# Altium schematic sheet stm32h750.SchDoc
size A3; SheetNumber: 5; SheetTotal: 17
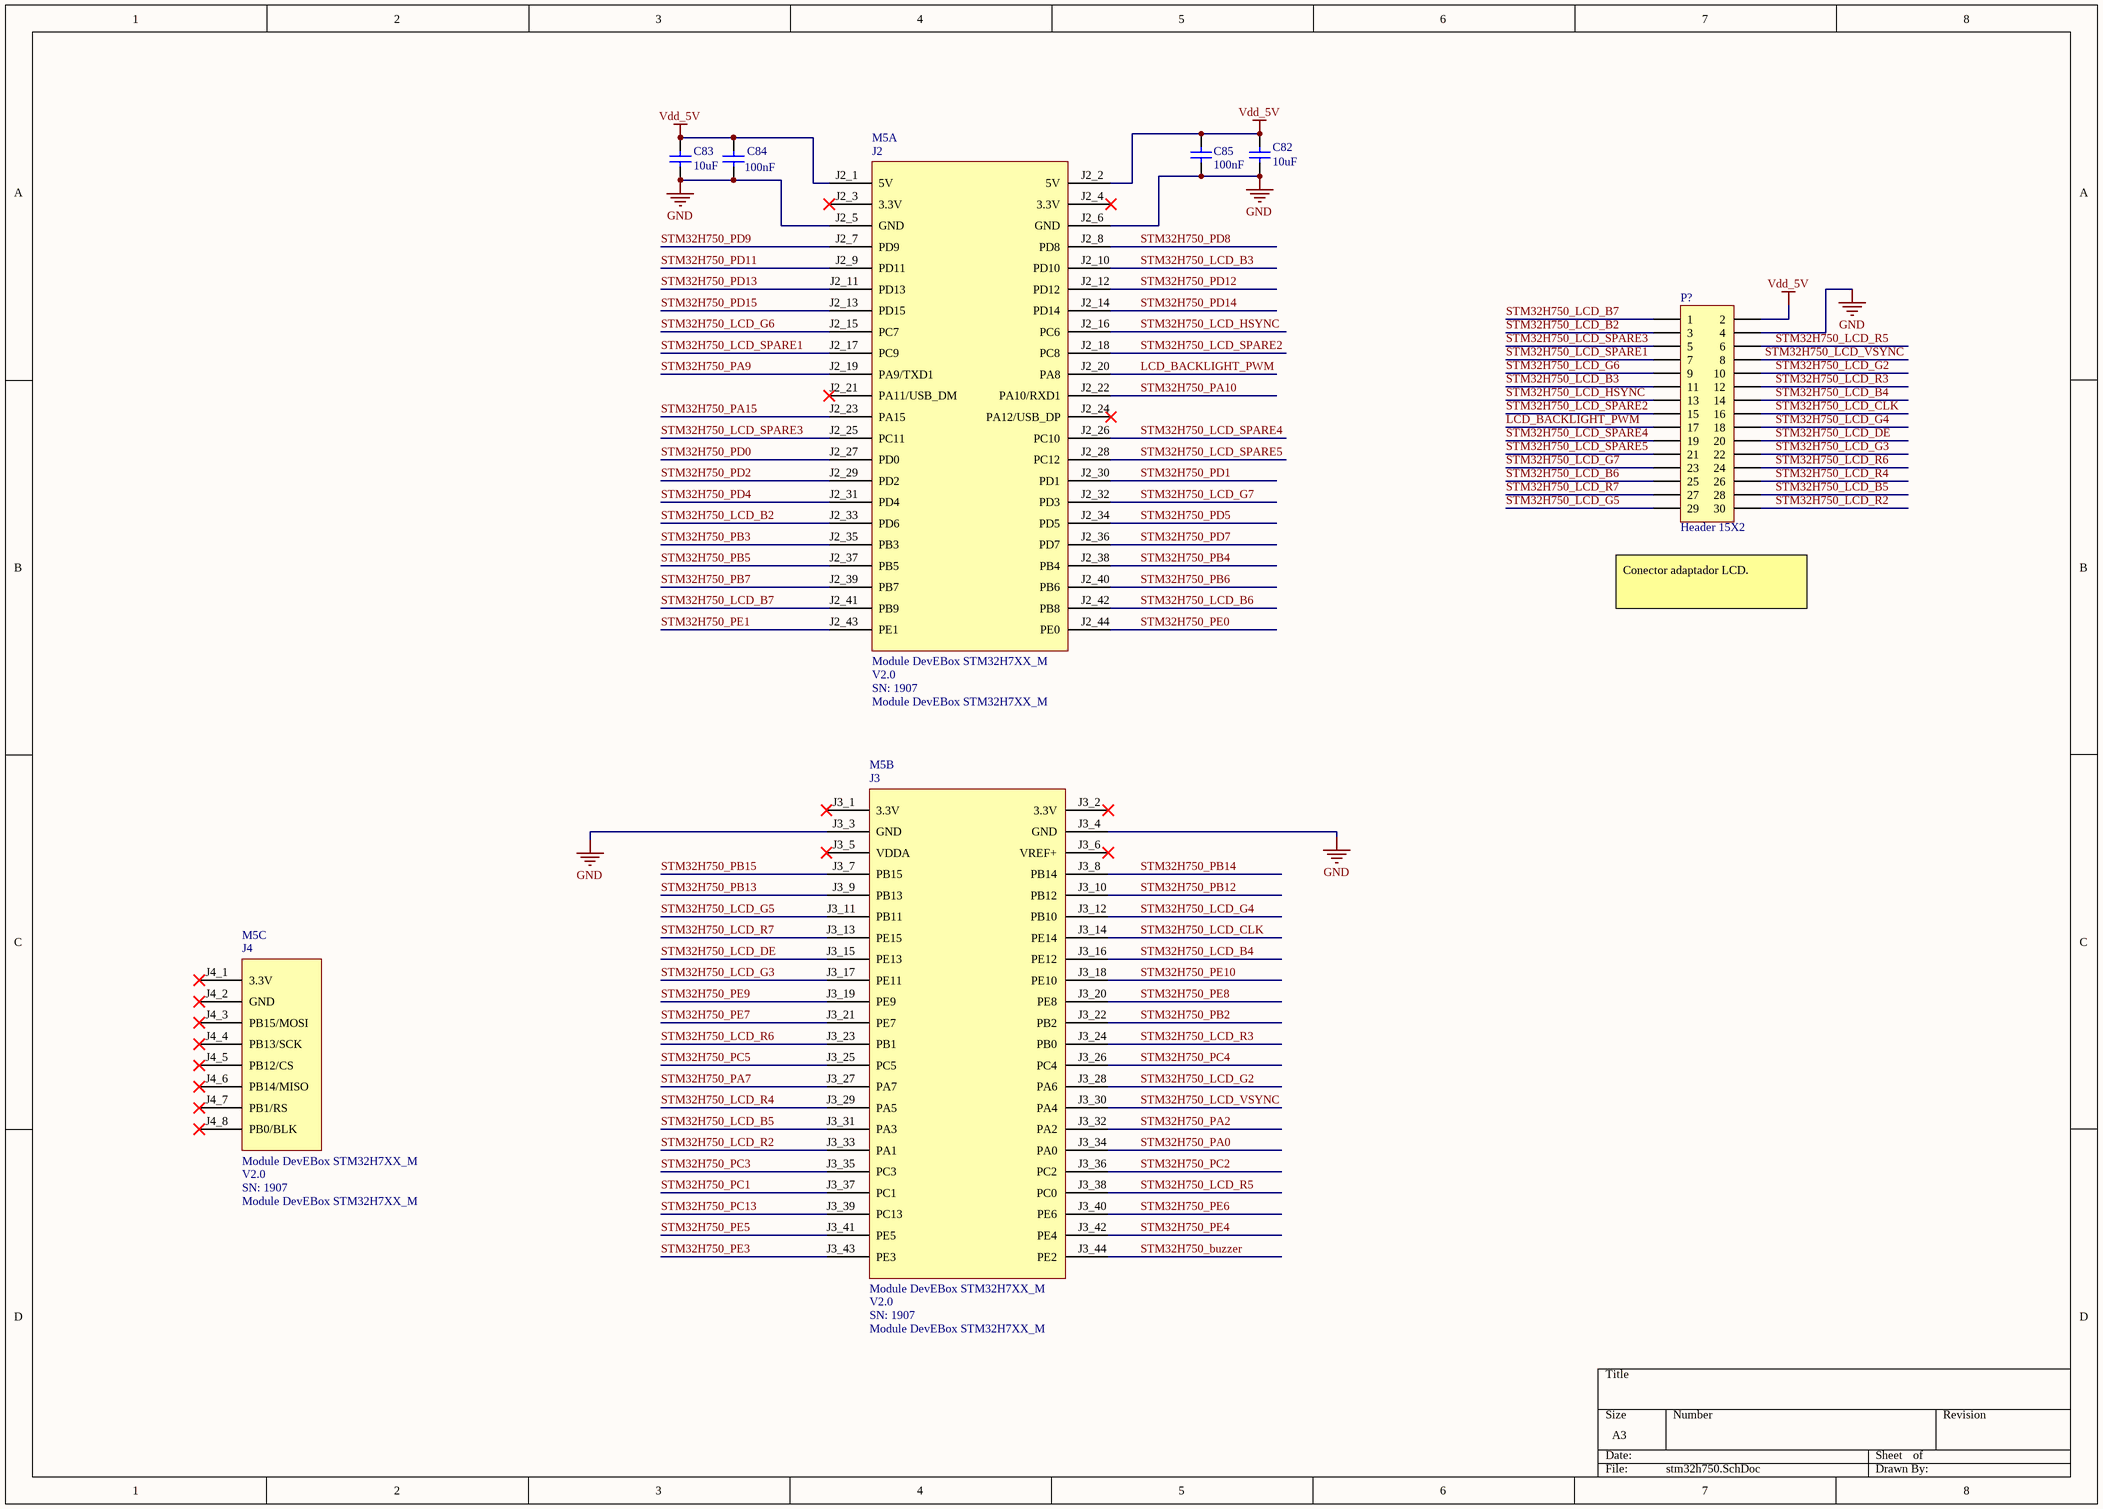
[diagram p0: stm32h750.SchDoc]

## Parts
C82  value 10uF  [capacitor 0603]  (hidden comment: ceramic capacitor)
C83  value 10uF  [capacitor 0603]  (hidden comment: ceramic capacitor)
C84  value 100nF  [capacitor 0603]  (hidden comment: Ceramic capacitor)
C85  value 100nF  [capacitor 0603]  (hidden comment: Ceramic capacitor)
M5  Module DevEBox STM32H7XX_M  [Module DevEBox STM32H7XX_M]  (parts A,B,C of 3)
P?  Header 15X2  [HDR2X15]

## Nets
GND: C82.1 C83.1 C84.1 C85.1 M5.J2_5(GND) M5.J2_6(GND) M5.J3_3(GND) M5.J3_4(GND) P?.4
Vdd_5V: C82.2 C83.2 C84.2 C85.2 M5.J2_1(5V) M5.J2_2(5V) P?.2
LCD_BACKLIGHT_PWM: M5.J2_20(PA8) P?.17
STM32H750_buzzer: M5.J3_44(PE2)
STM32H750_LCD_B2: M5.J2_33(PD6) P?.3
STM32H750_LCD_B3: M5.J2_10(PD10) P?.11
STM32H750_LCD_B4: M5.J3_16(PE12) P?.14
STM32H750_LCD_B5: M5.J3_31(PA3) P?.28
STM32H750_LCD_B6: M5.J2_42(PB8) P?.25
STM32H750_LCD_B7: M5.J2_41(PB9) P?.1
STM32H750_LCD_CLK: M5.J3_14(PE14) P?.16
STM32H750_LCD_DE: M5.J3_15(PE13) P?.20
STM32H750_LCD_G2: M5.J3_28(PA6) P?.10
STM32H750_LCD_G3: M5.J3_17(PE11) P?.22
STM32H750_LCD_G4: M5.J3_12(PB10) P?.18
STM32H750_LCD_G5: M5.J3_11(PB11) P?.29
STM32H750_LCD_G6: M5.J2_15(PC7) P?.9
STM32H750_LCD_G7: M5.J2_32(PD3) P?.23
STM32H750_LCD_HSYNC: M5.J2_16(PC6) P?.13
STM32H750_LCD_R2: M5.J3_33(PA1) P?.30
STM32H750_LCD_R3: M5.J3_24(PB0) P?.12
STM32H750_LCD_R4: M5.J3_29(PA5) P?.26
STM32H750_LCD_R5: M5.J3_38(PC0) P?.6
STM32H750_LCD_R6: M5.J3_23(PB1) P?.24
STM32H750_LCD_R7: M5.J3_13(PE15) P?.27
STM32H750_LCD_SPARE1: M5.J2_17(PC9) P?.7
STM32H750_LCD_SPARE2: M5.J2_18(PC8) P?.15
STM32H750_LCD_SPARE3: M5.J2_25(PC11) P?.5
STM32H750_LCD_SPARE4: M5.J2_26(PC10) P?.19
STM32H750_LCD_SPARE5: M5.J2_28(PC12) P?.21
STM32H750_LCD_VSYNC: M5.J3_30(PA4) P?.8
STM32H750_PA0: M5.J3_34(PA0)
STM32H750_PA2: M5.J3_32(PA2)
STM32H750_PA7: M5.J3_27(PA7)
STM32H750_PA9: M5.J2_19(PA9/TXD1)
STM32H750_PA10: M5.J2_22(PA10/RXD1)
STM32H750_PA15: M5.J2_23(PA15)
STM32H750_PB2: M5.J3_22(PB2)
STM32H750_PB3: M5.J2_35(PB3)
STM32H750_PB4: M5.J2_38(PB4)
STM32H750_PB5: M5.J2_37(PB5)
STM32H750_PB6: M5.J2_40(PB6)
STM32H750_PB7: M5.J2_39(PB7)
STM32H750_PB12: M5.J3_10(PB12)
STM32H750_PB13: M5.J3_9(PB13)
STM32H750_PB14: M5.J3_8(PB14)
STM32H750_PB15: M5.J3_7(PB15)
STM32H750_PC1: M5.J3_37(PC1)
STM32H750_PC2: M5.J3_36(PC2)
STM32H750_PC3: M5.J3_35(PC3)
STM32H750_PC4: M5.J3_26(PC4)
STM32H750_PC5: M5.J3_25(PC5)
STM32H750_PC13: M5.J3_39(PC13)
STM32H750_PD0: M5.J2_27(PD0)
STM32H750_PD1: M5.J2_30(PD1)
STM32H750_PD2: M5.J2_29(PD2)
STM32H750_PD4: M5.J2_31(PD4)
STM32H750_PD5: M5.J2_34(PD5)
STM32H750_PD7: M5.J2_36(PD7)
STM32H750_PD8: M5.J2_8(PD8)
STM32H750_PD9: M5.J2_7(PD9)
STM32H750_PD11: M5.J2_9(PD11)
STM32H750_PD12: M5.J2_12(PD12)
STM32H750_PD13: M5.J2_11(PD13)
STM32H750_PD14: M5.J2_14(PD14)
STM32H750_PD15: M5.J2_13(PD15)
STM32H750_PE0: M5.J2_44(PE0)
STM32H750_PE1: M5.J2_43(PE1)
STM32H750_PE3: M5.J3_43(PE3)
STM32H750_PE4: M5.J3_42(PE4)
STM32H750_PE5: M5.J3_41(PE5)
STM32H750_PE6: M5.J3_40(PE6)
STM32H750_PE7: M5.J3_21(PE7)
STM32H750_PE8: M5.J3_20(PE8)
STM32H750_PE9: M5.J3_19(PE9)
STM32H750_PE10: M5.J3_18(PE10)

Not connected (* = marked no-connect by the designer): M5 J2_3(3.3V)* J2_4(3.3V)* J2_21(PA11/USB_DM)* J2_24(PA12/USB_DP)* J3_1(3.3V)* J3_2(3.3V)* J3_5(VDDA)* J3_6(VREF+)* J4_1(3.3V)* J4_2(GND)* J4_3(PB15/MOSI)* J4_4(PB13/SCK)* J4_5(PB12/CS)* J4_6(PB14/MISO)* J4_7(PB1/RS)* J4_8(PB0/BLK)*

## Notes on the sheet
- (near P?) Conector adaptador LCD.
- (in symbol Module DevEBox STM32H7XX_M, part A) J2; V2.0; SN: 1907
- (in symbol Module DevEBox STM32H7XX_M, part B) J3; V2.0; SN: 1907
- (in symbol Module DevEBox STM32H7XX_M, part C) J4; V2.0; SN: 1907

## Library data of the parts
C82 C83 = ceramic capacitor: Multilayer ceramic capacitor; V: 6.3; LCSC part: C1691; Package: 0603
C84 C85 = Ceramic capacitor: Multilayer ceramic capacitor; V: 50; LCSC part: C14663; Package: 0603
M5 = Module DevEBox STM32H7XX_M: Module DevEBox STM32H7XX_M / V2.0 / SN: 1907
P? = Header 15X2: Header, 15-Pin, Dual row; LatestRevisionDate: 17-Jul-2002; LatestRevisionNote: Re-released for DXP Platform.; Publisher: Altium Limited